# Altium schematic sheet Cnnectors_power1.SchDoc
size C; SheetNumber: 3; SheetTotal: 9
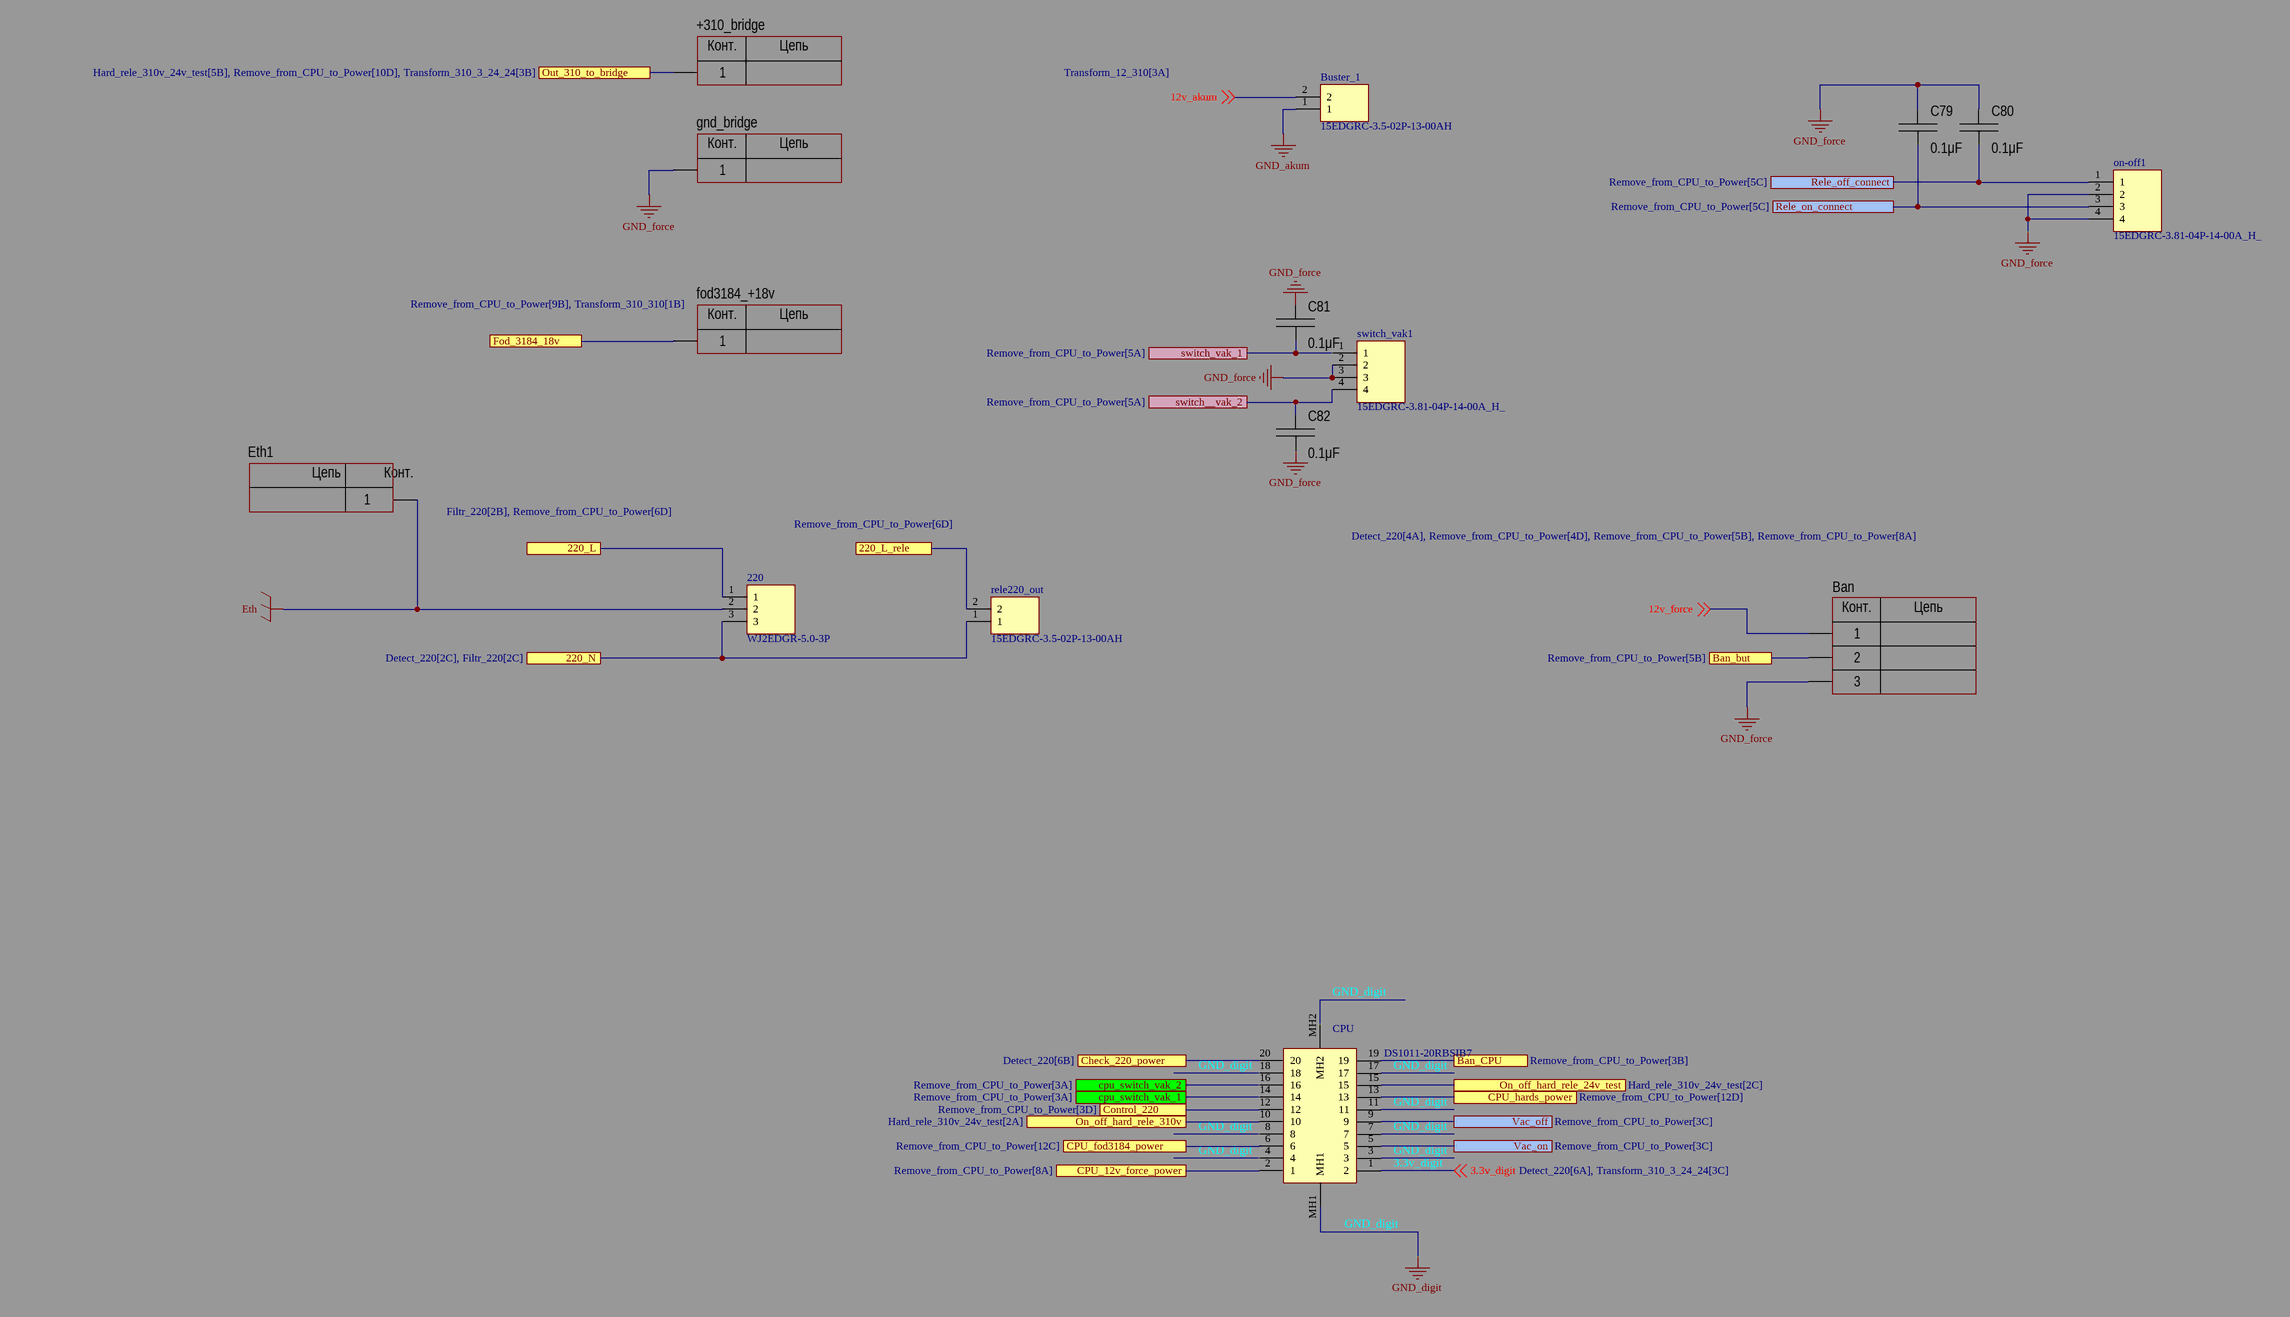
[diagram p0: Cnnectors_power1.SchDoc]

## Parts
220  WJ2EDGR-5.0-3P  [WJ2EDGR503P]
+310_bridge  (no value)  [CON: TH 3.5mm]
Ban  (no value)  [CON: 15EDGVC-3.5-03 (or 691321100003)]
Buster_1  15EDGRC-3.5-02P-13-00AH  [15EDGRC3502P1300AH]
C79  value 0.1μF  [CAP: 1206]
C80  value 0.1μF  [CAP: 1206]
C81  value 0.1μF  [CAP: 1206]
C82  value 0.1μF  [CAP: 1206]
CPU  DS1011-20RBSIB7  [DS101120RBSIB7]
Eth1  (no value)  [CON: TH 3.5mm]
fod3184_+18v  (no value)  [CON: TH 1mm]
gnd_bridge  (no value)  [CON: TH 3.5mm]
on-off1  15EDGRC-3.81-04P-14-00A_H_  [SHDRRA4W80P0X381_1X4_1603X920X754P]
rele220_out  15EDGRC-3.5-02P-13-00AH  [15EDGRC3502P1300AH]
switch_vak1  15EDGRC-3.81-04P-14-00A_H_  [SHDRRA4W80P0X381_1X4_1603X920X754P]

## Ports
220_L (see Filtr_220[2B], Remove_from_CPU_to_Power[6D]), 220_L_rele (see Remove_from_CPU_to_Power[6D]), 220_N (see Detect_220[2C], Filtr_220[2C]), Ban_but (see Remove_from_CPU_to_Power[5B]), Ban_CPU (see Remove_from_CPU_to_Power[3B]), Check_220_power (see Detect_220[6B]), Control_220 (see Remove_from_CPU_to_Power[3D]), CPU_12v_force_power (see Remove_from_CPU_to_Power[8A]), CPU_fod3184_power (see Remove_from_CPU_to_Power[12C]), CPU_hards_power (see Remove_from_CPU_to_Power[12D]), cpu_switch_vak_1 (see Remove_from_CPU_to_Power[3A]), cpu_switch_vak_2 (see Remove_from_CPU_to_Power[3A]), Fod_3184_18v (see Remove_from_CPU_to_Power[9B], Transform_310_310[1B]), On_off_hard_rele_24v_test (see Hard_rele_310v_24v_test[2C]), On_off_hard_rele_310v (see Hard_rele_310v_24v_test[2A]), Out_310_to_bridge (see Hard_rele_310v_24v_test[5B], Remove_from_CPU_to_Power[10D], Transform_310_3_24_24[3B]), Rele_off_connect (see Remove_from_CPU_to_Power[5C]), Rele_on_connect (see Remove_from_CPU_to_Power[5C]), switch__vak_2 (see Remove_from_CPU_to_Power[5A]), switch_vak_1 (see Remove_from_CPU_to_Power[5A]), Vac_off (see Remove_from_CPU_to_Power[3C]), Vac_on (see Remove_from_CPU_to_Power[3C])

## Nets
Eth: 220.2 Eth1.1
GND_akum: Buster_1.1
GND_digit: CPU.3 CPU.4 CPU.7 CPU.8 CPU.11 CPU.17 CPU.18 CPU.MH1 CPU.MH2
GND_force: Ban.3 C79.1 C80.1 C81.1 C82.2 gnd_bridge.1 on-off1.2 on-off1.4 switch_vak1.2 switch_vak1.3
3.3v_digit: CPU.1(2) ; off-sheet 3.3v_digit
12v_akum: Buster_1.2 ; off-sheet 12v_akum
12v_force: Ban.1 ; off-sheet 12v_force
220_L: 220.1 ; port 220_L
220_L_rele: rele220_out.2 ; port 220_L_rele
220_N: 220.3 rele220_out.1 ; port 220_N
Ban_but: Ban.2 ; port Ban_but
Ban_CPU: CPU.19 ; port Ban_CPU
Check_220_power: CPU.20 ; port Check_220_power
Control_220: CPU.12 ; port Control_220
CPU_12v_force_power: CPU.2(1) ; port CPU_12v_force_power
CPU_fod3184_power: CPU.6 ; port CPU_fod3184_power
CPU_hards_power: CPU.13 ; port CPU_hards_power
cpu_switch_vak_1: CPU.14 ; port cpu_switch_vak_1
cpu_switch_vak_2: CPU.16 ; port cpu_switch_vak_2
Fod_3184_18v: fod3184_+18v.1 ; port Fod_3184_18v
On_off_hard_rele_24v_test: CPU.15 ; port On_off_hard_rele_24v_test
On_off_hard_rele_310v: CPU.10 ; port On_off_hard_rele_310v
Out_310_to_bridge: +310_bridge.1 ; port Out_310_to_bridge
Rele_off_connect: C80.2 on-off1.1 ; port Rele_off_connect
Rele_on_connect: C79.2 on-off1.3 ; port Rele_on_connect
switch__vak_2: C82.1 switch_vak1.4 ; port switch__vak_2
switch_vak_1: C81.2 switch_vak1.1 ; port switch_vak_1
Vac_off: CPU.9 ; port Vac_off
Vac_on: CPU.5 ; port Vac_on

## Notes on the sheet
- (in symbol Connector_single_power) Цепь; Конт.
- (in symbol Connector_terminal_3pin) Конт.; Цепь

## Library data of the parts
220 = WJ2EDGR-5.0-3P: Connector; Manufacturer_Name: Ningbo Kangnex; Datasheet Link: https://datasheet.lcsc.com/lcsc/1912251636_Ningbo-Kangnex-Elec-WJ2EDGR-5-0-3P_C8480.pdf; Height: 8.4mm; Manufacturer_Part_Number: WJ2EDGR-5.0-3P
+310_bridge Eth1 fod3184_+18v gnd_bridge = Connector_single_power: ValueManufacturerPartNumber: Power connector, *, *; TypeConnector: Power connector; CommentText: "Разъем"; Manufacturer: *; HelpURL: *; PartNumber: *; VoltageMax: *; CurrentMax: *
Ban = Connector_terminal_3pin: Manufacturer: Degson; ValueManufacturerPartNumber: Terminal connector, 3pin, 3.5mm, 300VAC, 10A; PartNumber: DG350-3.5-03P-14; TypeConnector: Terminal connector; VoltageMax: 300VAC; Pitch: 3.5mm; CurrentMax: 10A; Multichannel: 3pin; CommentText: "Разъем"; HelpURL: https://www.chipdip.ru/product/dg350-3.5-03p-12
Buster_1 rele220_out = 15EDGRC-3.5-02P-13-00AH: Connector; Manufacturer_Name: Degson; Datasheet Link: https://www.tme.eu/Document/c7e2facf434c6541c93efde757aaf5e6/607.pdf; Height: 7mm; Manufacturer_Part_Number: 15EDGRC-3.5-02P-13-00AH
C79-C82 = Ceramic_1206: Manufacturer: Yageo; PartNumber: CC1206KRX7R9BB104; ValueManufacturerPartNumber: Ceramic capacitor, 0.1μF, X7R, ±10%, 50V, 1206, -55...+125°C; TypeCapacitor: Ceramic capacitor; Tolerance: ±10%; TypeDielectric: X7R; Voltage: 50V; Package: 1206; HelpURL: https://www.digikey.com/product-detail/en/yageo/CC1206KRX7R9BB104/311-1179-1-ND/303089; Temperature: -55...+125°C
CPU = DS1011-20RBSIB7: Connector; Manufacturer_Name: Connfly; Datasheet Link: https://www.tme.com/Document/a911e76bcf9b13f23ffda9abd299f5e3/DS1011.pdf; Height: 8.7mm; Manufacturer_Part_Number: DS1011-20RBSIB7
on-off1 switch_vak1 = 15EDGRC-3.81-04P-14-00A_H_: Connector; Manufacturer_Name: Degson; Manufacturer_Part_Number: 15EDGRC-3.81-04P-14-00A(H); Datasheet Link: https://datasheet.octopart.com/15EDGRC-3.81-04P-14-00A%28H%29-Degson-datasheet-17801160.pdf; Height: 7.54mm